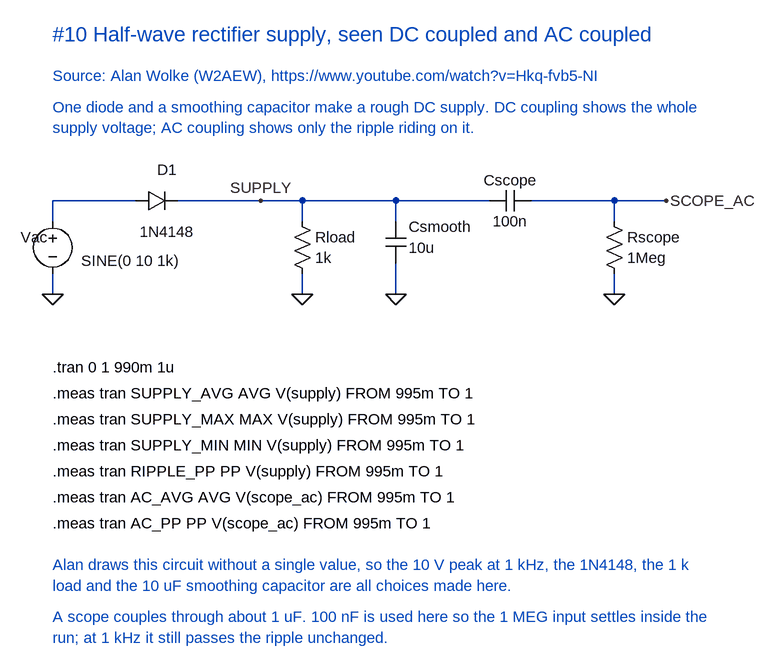
[diagram p0: schematic Half-wave rectifier supply.asc]
Half-wave rectifier supply.asc, the LTspice schematic file:
Version 4
SHEET 1 1600 900
WIRE 160 240 160 272
WIRE 160 352 160 384
WIRE 160 240 288 240
WIRE 352 240 544 240
WIRE 544 240 544 272
WIRE 544 352 544 384
WIRE 544 240 688 240
WIRE 688 240 688 272
WIRE 688 336 688 384
WIRE 688 240 832 240
WIRE 896 240 1024 240
WIRE 1024 240 1104 240
WIRE 1024 240 1024 272
WIRE 1024 352 1024 384
FLAG 160 384 0
FLAG 544 384 0
FLAG 688 384 0
FLAG 1024 384 0
FLAG 480 240 SUPPLY
FLAG 1104 240 SCOPE_AC
SYMBOL voltage 160 256 R0
WINDOW 0 -8 40 Right 2
WINDOW 3 44 76 Left 2
SYMATTR InstName Vac
SYMATTR Value SINE(0 10 1k)
SYMBOL diode 288 256 R270
WINDOW 0 48 48 VTop 2
WINDOW 3 -16 48 VBottom 2
SYMATTR InstName D1
SYMATTR Value 1N4148
SYMBOL res 528 256 R0
WINDOW 0 36 40 Left 2
WINDOW 3 36 72 Left 2
SYMATTR InstName Rload
SYMATTR Value 1k
SYMBOL cap 672 272 R0
WINDOW 0 36 8 Left 2
WINDOW 3 36 40 Left 2
SYMATTR InstName Csmooth
SYMATTR Value 10u
SYMBOL cap 896 224 R90
WINDOW 0 0 32 VBottom 2
WINDOW 3 32 32 VTop 2
SYMATTR InstName Cscope
SYMATTR Value 100n
SYMBOL res 1008 256 R0
WINDOW 0 36 40 Left 2
WINDOW 3 36 72 Left 2
SYMATTR InstName Rscope
SYMATTR Value 1Meg
TEXT 160 -16 Left 3 ;#10 Half-wave rectifier supply, seen DC coupled and AC coupled
TEXT 160 48 Left 2 ;Source: Alan Wolke (W2AEW), https://www.youtube.com/watch?v=Hkq-fvb5-NI
TEXT 160 96 Left 2 ;One diode and a smoothing capacitor make a rough DC supply. DC coupling shows the whole
TEXT 160 128 Left 2 ;supply voltage; AC coupling shows only the ripple riding on it.
TEXT 160 496 Left 2 !.tran 0 1 990m 1u
TEXT 160 536 Left 2 !.meas tran SUPPLY_AVG AVG V(supply) FROM 995m TO 1
TEXT 160 576 Left 2 !.meas tran SUPPLY_MAX MAX V(supply) FROM 995m TO 1
TEXT 160 616 Left 2 !.meas tran SUPPLY_MIN MIN V(supply) FROM 995m TO 1
TEXT 160 656 Left 2 !.meas tran RIPPLE_PP PP V(supply) FROM 995m TO 1
TEXT 160 696 Left 2 !.meas tran AC_AVG AVG V(scope_ac) FROM 995m TO 1
TEXT 160 736 Left 2 !.meas tran AC_PP PP V(scope_ac) FROM 995m TO 1
TEXT 160 800 Left 2 ;Alan draws this circuit without a single value, so the 10 V peak at 1 kHz, the 1N4148, the 1 k
TEXT 160 832 Left 2 ;load and the 10 uF smoothing capacitor are all choices made here.
TEXT 160 880 Left 2 ;A scope couples through about 1 uF. 100 nF is used here so the 1 MEG input settles inside the
TEXT 160 912 Left 2 ;run; at 1 kHz it still passes the ripple unchanged.

The netlist it stands for:
* Half-wave rectifier supply.asc
Vac N001 0 SINE(0 10 1k)
D1 N001 SUPPLY 1N4148
Rload SUPPLY 0 1k
Csmooth SUPPLY 0 10u
Cscope SCOPE_AC SUPPLY 100n
Rscope SCOPE_AC 0 1Meg
.model D D
.lib standard.dio
* #10 Half-wave rectifier supply, seen DC coupled and AC coupled
* Source: Alan Wolke (W2AEW), https://www.youtube.com/watch?v=Hkq-fvb5-NI
* One diode and a smoothing capacitor make a rough DC supply. DC coupling shows the whole
* supply voltage; AC coupling shows only the ripple riding on it.
.tran 0 1 990m 1u
.meas tran SUPPLY_AVG AVG V(supply) FROM 995m TO 1
.meas tran SUPPLY_MAX MAX V(supply) FROM 995m TO 1
.meas tran SUPPLY_MIN MIN V(supply) FROM 995m TO 1
.meas tran RIPPLE_PP PP V(supply) FROM 995m TO 1
.meas tran AC_AVG AVG V(scope_ac) FROM 995m TO 1
.meas tran AC_PP PP V(scope_ac) FROM 995m TO 1
* Alan draws this circuit without a single value, so the 10 V peak at 1 kHz, the 1N4148, the 1 k
* load and the 10 uF smoothing capacitor are all choices made here.
* A scope couples through about 1 uF. 100 nF is used here so the 1 MEG input settles inside the
* run; at 1 kHz it still passes the ripple unchanged.
.backanno
.end